# Altium schematic sheet ScreenerPhotodiodeSense.SchDoc
size A4; SheetNumber: 1; SheetTotal: 1
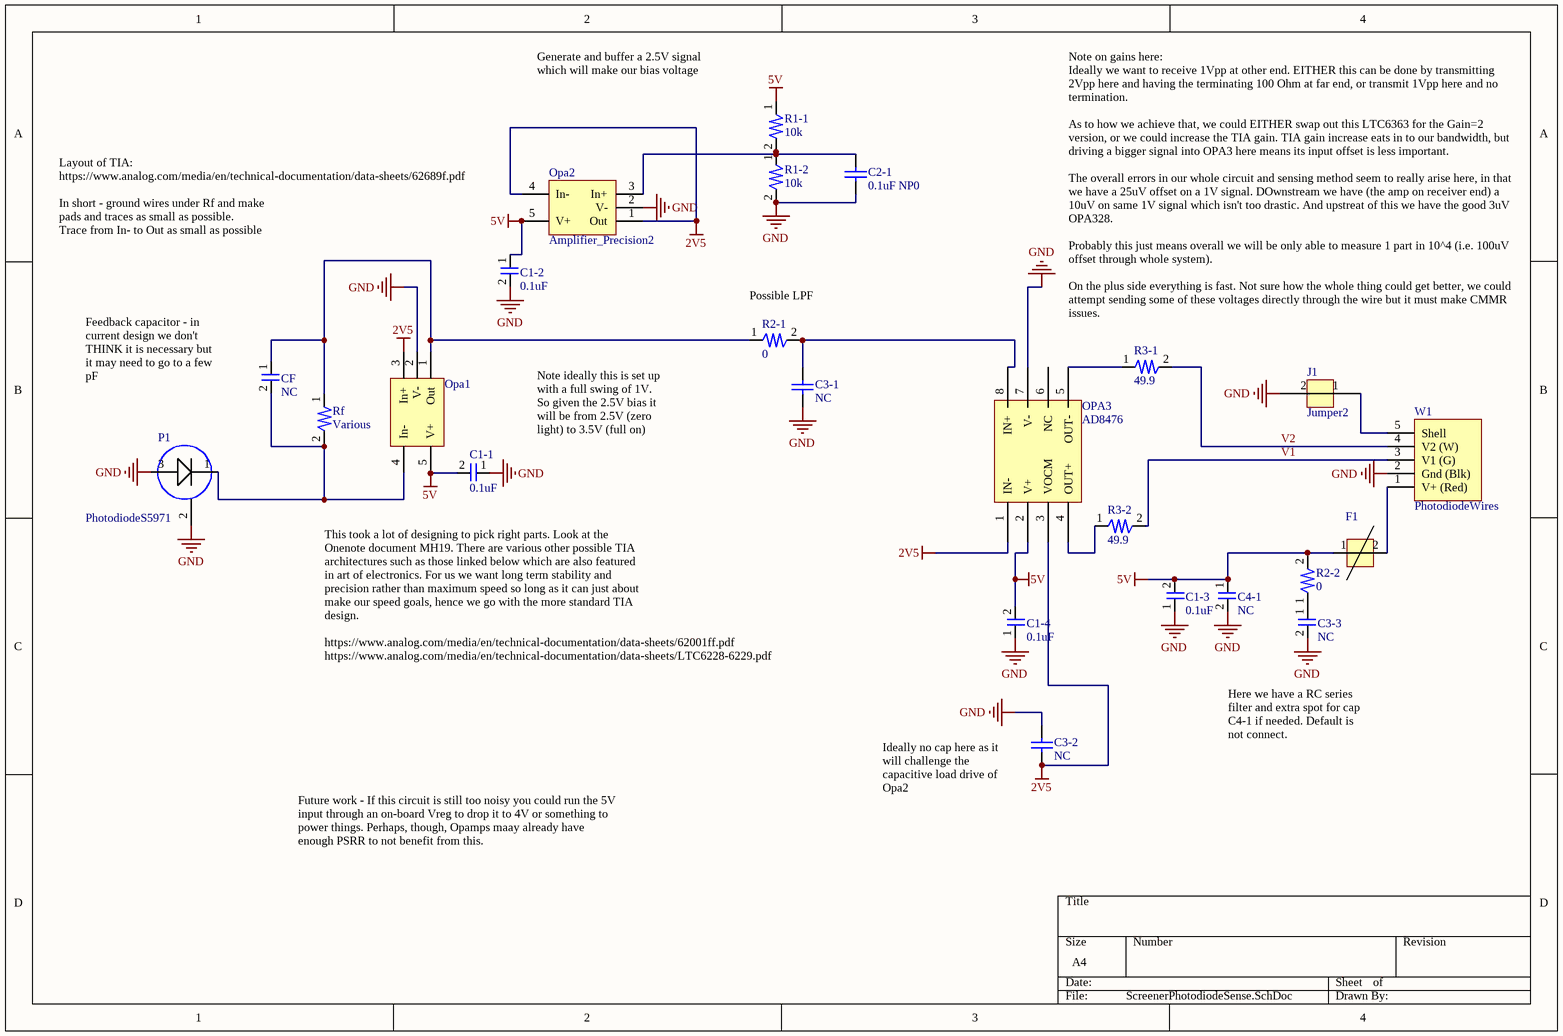
[diagram p0: ScreenerPhotodiodeSense.SchDoc]

## Parts
C1-1  0.1uF  [0805]
C1-2  0.1uF  [0805]
C1-3  0.1uF  [0805]
C1-4  0.1uF  [0805]
C2-1  0.1uF NP0  [1206_Wide]
C3-1  NC  [0805]
C3-2  NC  [0805]
C3-3  NC  [0805]
C4-1  NC  [1206]
CF  NC  [0805_Compact]
F1  FerriteBead1  [0805]  (value not drawn)
J1  Jumper2  [Jumper2]
Opa1  Amplifier_TIA  [SOT23-5]  (value not drawn)
Opa2  Amplifier_Precision2  [SOT23-5]
OPA3  AD8476  [8-MSOP]
P1  PhotodiodeS5971  [TO-18]
R1-1  10k  [0805_Compact]
R1-2  10k  [0805_Compact]
R2-1  0  [0805_Compact]
R2-2  0  [0805_Compact]
R3-1  49.9  [0805_Compact]
R3-2  49.9  [0805_Compact]
Rf  Various  [0805_Compact]
W1  PhotodiodeWires  [PhotodiodeWires]

## Nets
2V5: C3-2.1 Opa1.3(In+) Opa2.1(Out) Opa2.4(In-) OPA3.1(IN-) OPA3.3(VOCM)
5V: C1-1.2 C1-2.1 C1-3.2 C1-4.2 C4-1.1 F1.1 Opa1.5(V+) Opa2.5(V+) OPA3.2(V+) R1-1.1 R2-2.2
GND: C1-1.1 C1-2.2 C1-3.1 C1-4.1 C2-1.2 C3-1.2 C3-2.2 C3-3.2 C4-1.2 J1.2 Opa1.2(V-) Opa2.2(V-) OPA3.7(V-) P1.2(Case) P1.3(Pin) R1-2.2 W1.2(Gnd_(Blk))
V1: R3-2.2 W1.3(V1_(G))
V2: R3-1.2 W1.4(V2_(W))
NetC2-1_1: C2-1.1 Opa2.3(In+) R1-1.2 R1-2.1
NetC3-1_1: C3-1.1 OPA3.8(IN+) R2-1.2
NetC3-3_1: C3-3.1 R2-2.1
NetCF_1: CF.1 Opa1.1(Out) R2-1.1 Rf.1
NetCF_2: CF.2 Opa1.4(In-) P1.1(Pin) Rf.2
NetF1_2: F1.2 W1.1(V+_(Red))
NetJ1_1: J1.1 W1.5(Shell)
NetOPA3_4: OPA3.4(OUT+) R3-2.1
NetOPA3_5: OPA3.5(OUT-) R3-1.1

Not connected (* = marked no-connect by the designer): OPA3 6(NC)

## Notes on the sheet
- Generate and buffer a 2.5V signal which will make our bias voltage
- Layout of TIA: https://www.analog.com/media/en/technical-documentation/data-sheets/62689f.pdf
  In short - ground wires under Rf and make pads and traces as small as possible.
  Trace from In- to Out as small as possible
- (near R2-1) Possible LPF
- (near R3-1) Note on gains here:
  Ideally we want to receive 1Vpp at other end. EITHER this can be done by transmitting 2Vpp here and having the terminating 100 Ohm at far end, or transmit 1Vpp here and no termination.
  As to how we achieve that, we could EITHER swap out this LTC6363 for the Gain=2 version, or we could increase the TIA gain. TIA gain increase eats in to our bandwidth, but driving a bigger signal into OPA3 here means its input offset is less important.
  The overall errors in our whole circuit and sensing method seem to really arise here, in that we have a 25uV offset on a 1V signal. DOwnstream we have (the amp on receiver end) a 10uV on same 1V signal which isn't too drastic. And upstreat of this we have the good 3uV OPA328.
  Probably this just means overall we will be only able to measure 1 part in 10^4 (i.e. 100uV offset through whole system).
  On the plus side everything is fast. Not sure how the whole thing could get better, we could attempt sending some of these voltages directly through the wire but it must make CMMR issues.
- Feedback capacitor - in current design we don't THINK it is necessary but it may need to go to a few pF
- Note ideally this is set up with a full swing of 1V.
  So given the 2.5V bias it will be from 2.5V (zero light) to 3.5V (full on)
- This took a lot of designing to pick right parts. Look at the Onenote document MH19. There are various other possible TIA architectures such as those linked below which are also featured in art of electronics. For us we want long term stability and precision rather than maximum speed so long as it can just about make our speed goals, hence we go with the more standard TIA design.
  https://www.analog.com/media/en/technical-documentation/data-sheets/62001ff.pdf
  https://www.analog.com/media/en/technical-documentation/data-sheets/LTC6228-6229.pdf
- Here we have a RC series filter and extra spot for cap C4-1 if needed. Default is not connect.
- (near C3-2) Ideally no cap here as it will challenge the capacitive load drive of Opa2
- Future work - If this circuit is still too noisy you could run the 5V input through an on-board Vreg to drop it to 4V or something to power things. Perhaps, though, Opamps maay already have enough PSRR to not benefit from this.

## Library data of the parts
C1-1-C1-4 C3-3 C4-1 CF = Capacitor1
  C3-3 C4-1: Digikey P/N: 490-14531-1-ND
  CF: Digikey P/N: 311-4124-1-ND, 311-4134-1-ND, 311-4130-1-ND, 13-CC0805BRNPO9BN5R6CT-ND
C2-1 C3-1 C3-2 = Cap 0805: Capacitor
  C2-1: Digikey P/N: 445-6984-1-ND
R1-1 R1-2 R2-1 R2-2 R3-1 R3-2 Rf = Res1
  R1-1 R1-2 R2-1: Digikey P/N: TNPU10.0KBBCT-ND
  R2-2 R3-1 R3-2: Digikey P/N: 738-RNCF0805TKY49R9CT-ND
  Rf: Digikey P/N: 541-TNPU08052K49BZEN00CT-ND, 541-4671-1-ND, 2019-RN73R2ATTD6192B05CT-ND, 541-TNPU080547K5BZEN00CT-ND, 2019-RN73R2ATTD3242A05CT-ND, 2019-RN73R2ATTD2292B05CT-ND,  2019-RN73R2ATTD1562B05CT-ND, 541-TNPU080515K0BZEN00CT-ND, 541-TNPU08057K50BZEN00CT-ND, 541-4456-1-ND, 541-TNPU08055K10BZEN00CT-ND,  541-4454-1-ND
F1 = FerriteBead1: Digikey P/N: 445-MPZ2012S331ATD25CT-ND
Opa1 = Amplifier_TIA: Digikey P/N: 296-OPA328DBVRCT-ND
Opa2 = Amplifier_Precision2: Digikey P/N: 296-OPA388QDBVRQ1CT-ND
OPA3 = AD8476: Digikey P/N: 505-AD8476BRMZ-ND
P1 = PhotodiodeS5971: Digikey P/N: 124-7158